# Altium schematic sheet Esquematico1.SchDoc
size A4; SheetNumber: 1; SheetTotal: 2
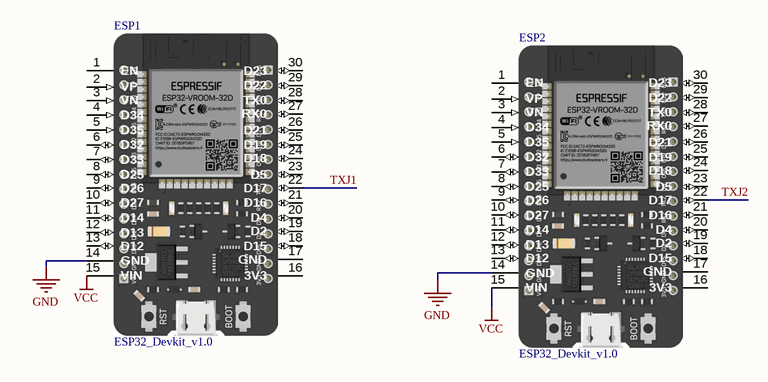
[diagram p0: Esquematico1.SchDoc]

## Parts
ESP1  ESP32_Devkit_v1.0  [ESP_32_DEKIT_V1.0]
ESP2  ESP32_Devkit_v1.0  [ESP_32_DEKIT_V1.0]

## Nets
GND: ESP1.14(GND) ESP2.14(GND)
VCC: ESP1.15(VIN) ESP2.15(VIN)
TXJ1: ESP1.22(D17)
TXJ2: ESP2.22(D17)

Not connected (* = marked no-connect by the designer): ESP1 1(EN) 2(VP) 3(VN) 4(D34) 5(D35) 6(D32) 7(D33) 8(D25) 9(D26) 10(D27) 11(D14) 12(D13) 13(D12) 16(3V3) 17(GND) 18(D15) 19(D2) 20(D4) 21(D16) 23(D5) 24(D18) 25(D19) 26(D21) 27(RX0) 28(TX0) 29(D22) 30(D23); ESP2 1(EN) 2(VP) 3(VN) 4(D34) 5(D35) 6(D32) 7(D33) 8(D25) 9(D26) 10(D27) 11(D14) 12(D13) 13(D12) 16(3V3) 17(GND) 18(D15) 19(D2) 20(D4) 21(D16) 23(D5) 24(D18) 25(D19) 26(D21) 27(RX0) 28(TX0) 29(D22) 30(D23)

## Library data of the parts
ESP1 ESP2 = ESP32_Devkit_v1.0: ESP32 Development kit v1.0